# Altium schematic sheet FLASH QSPI.SchDoc
size A
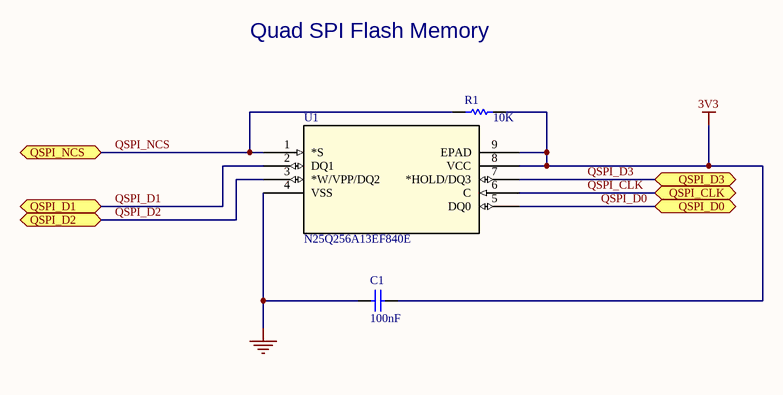
[diagram p0: FLASH QSPI.SchDoc]

## Parts
C1  100nF  [0603]
R1  10K  [0603]
U1  N25Q256A13EF840E  [N25Q256A13EF840E]

## Ports
QSPI_CLK, QSPI_D0, QSPI_D1, QSPI_D2, QSPI_D3, QSPI_NCS

## Nets
3V3: C1.1 R1.2 U1.8(VCC) U1.9(EPAD)
GND: C1.2 U1.4(VSS)
QSPI_CLK: U1.6(C) ; port QSPI_CLK
QSPI_D0: U1.5(DQ0) ; port QSPI_D0
QSPI_D1: U1.2(DQ1) ; port QSPI_D1
QSPI_D2: U1.3(*W/VPP/DQ2) ; port QSPI_D2
QSPI_D3: U1.7(*HOLD/DQ3) ; port QSPI_D3
QSPI_NCS: R1.1 U1.1(*S) ; port QSPI_NCS

## Notes on the sheet
- Quad SPI Flash Memory

## Library data of the parts
C1 = Cap_100nF_X7R_10%_0402: 0201; Manuf_Part_1: CC0402KRX7R7BB104; Manuf_1: YAGEO; Revision: July-2002: Re-released for DXP Platform.; Value: 100nF; Order: CC0402KRX7R7BB104; ECCN_US/EU: n/a
R1 = Res_10K_1%_0402: 0201; Manuf_Part_1: RC0402FR-0710KL; Manuf_1: YAGEO; Value: 10K; Order: RC0402FR-0710KL; ECCN_US/EU: n/a